# Altium project PCB_Project_MAGNIS-v1-GroundStation.PrjPcb
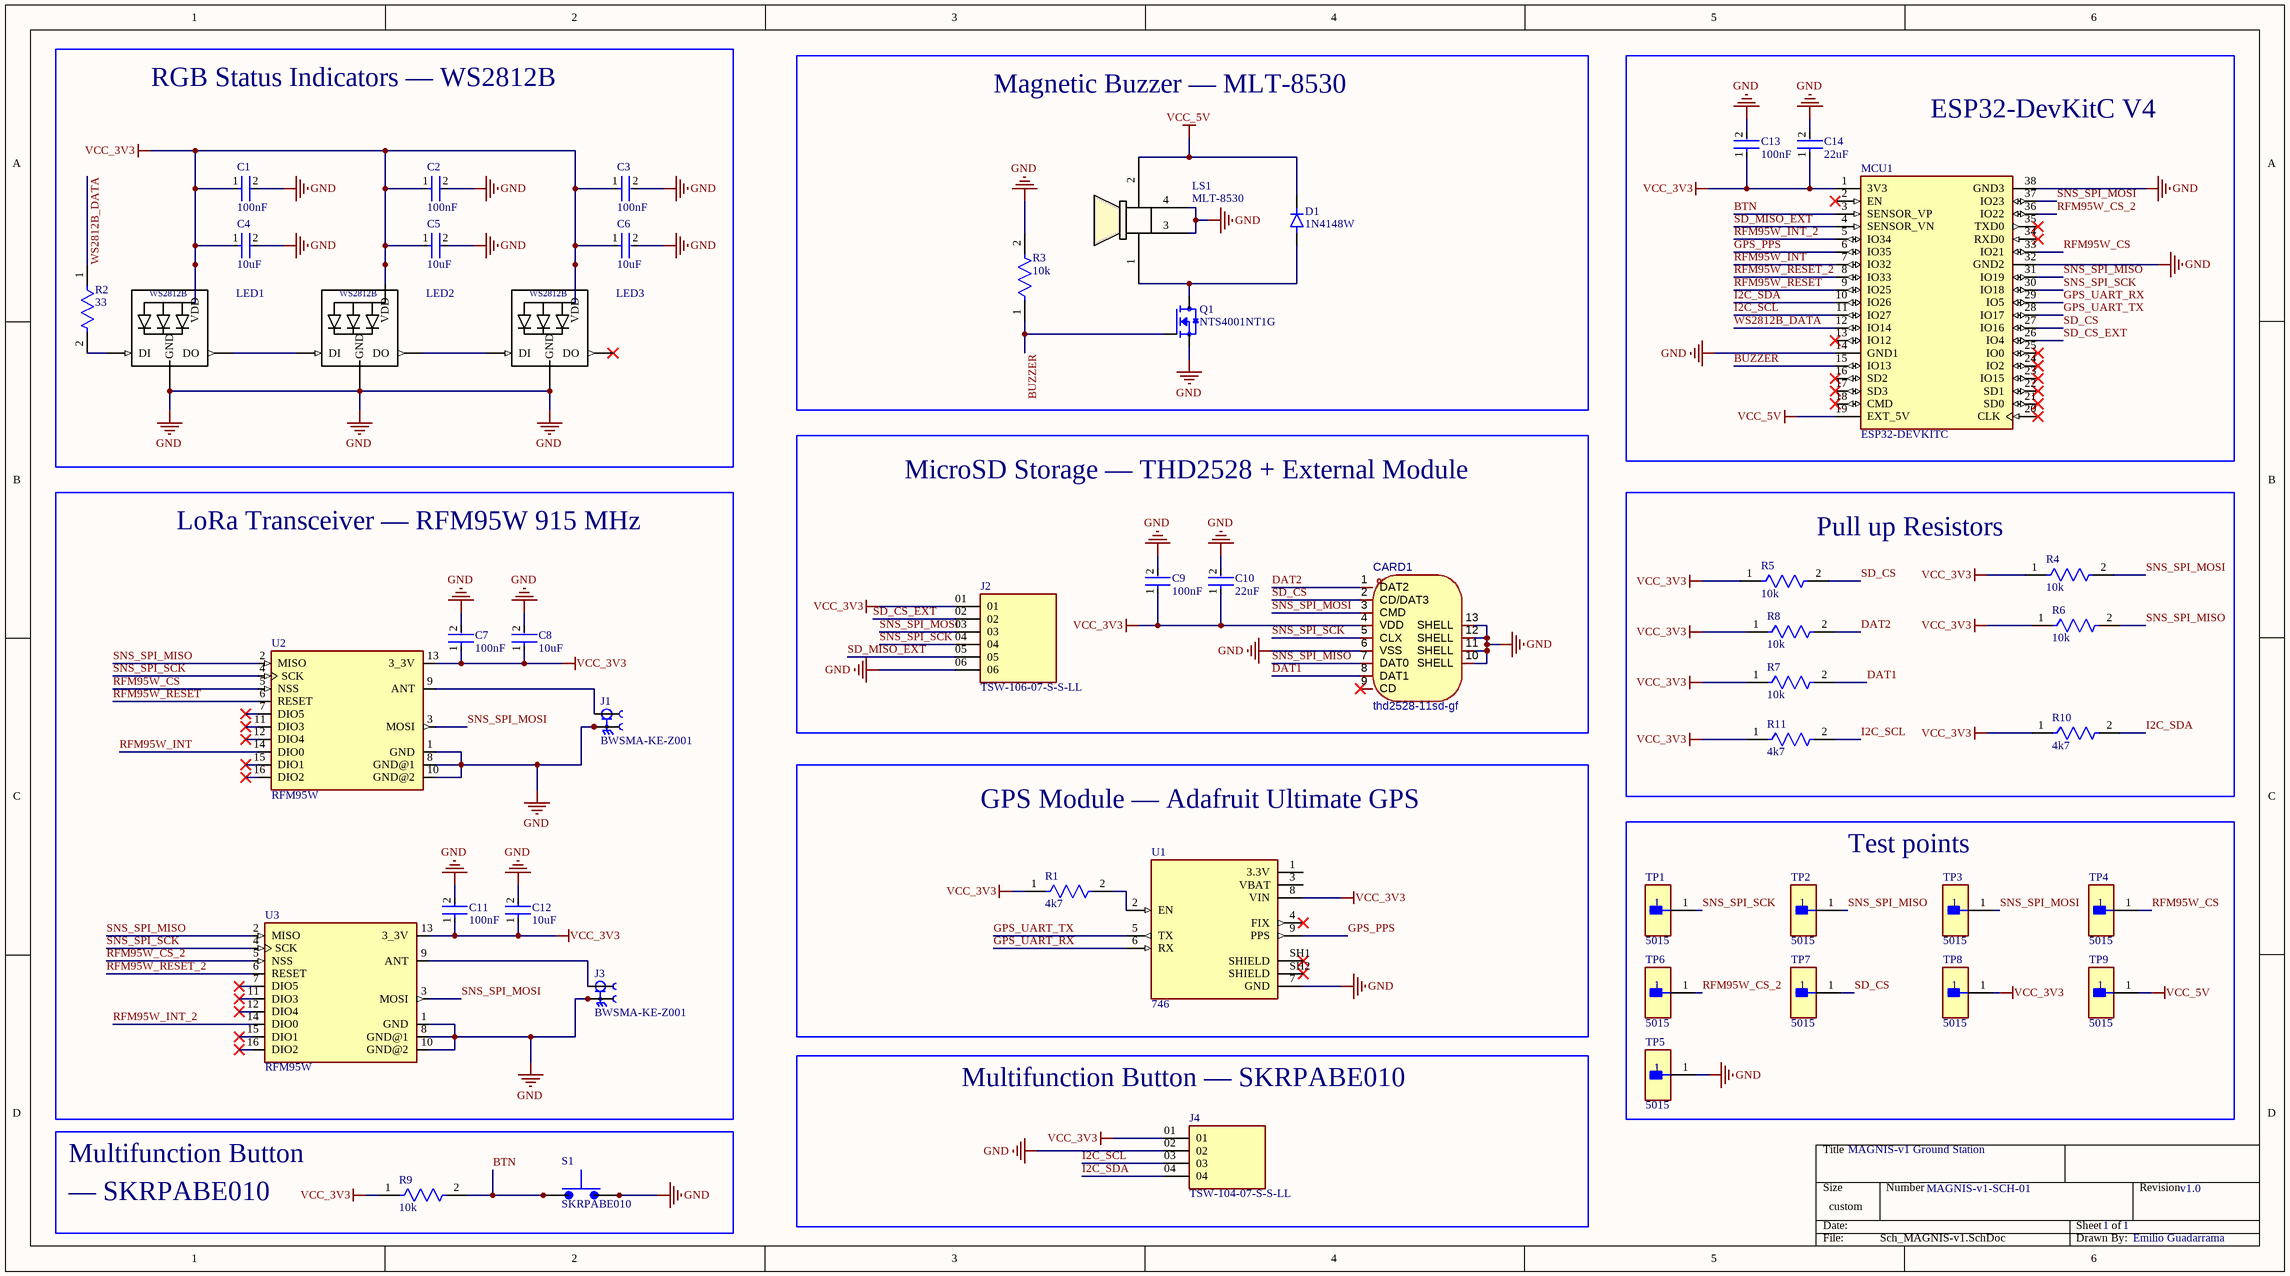
[diagram p0: Sch_MAGNIS-v1.SchDoc]
1 sheet, 50 parts. Net scope: global (net labels, ports and power ports of the same name join across sheets).
Board file: PCB_MAGNIS-v1.PcbDoc

## Sheet Sch_MAGNIS-v1.SchDoc
size 457 x 254 mm; SheetNumber: 1; SheetTotal: 1

### Parts
C1  100nF  [FP-C0805C-DN-MFG]
C2  100nF  [FP-C0805C-DN-MFG]
C3  100nF  [FP-C0805C-DN-MFG]
C4  10uF  [FP-C0805C-DN-MFG]
C5  10uF  [FP-C0805C-DN-MFG]
C6  10uF  [FP-C0805C-DN-MFG]
C7  100nF  [FP-C0805C-DN-MFG]
C8  10uF  [FP-C0805C-DN-MFG]
C9  100nF  [FP-C0805C-DN-MFG]
C10  22uF  [FP-C0805C-DN-MFG]
C11  100nF  [FP-C0805C-DN-MFG]
C12  10uF  [FP-C0805C-DN-MFG]
C13  100nF  [FP-C0805C-DN-MFG]
C14  22uF  [FP-C0805C-DN-MFG]
CARD1  thd2528-11sd-gf  [PCBComponent_1]
D1  1N4148W  [SODFL3816X120N]
J1  BWSMA-KE-Z001  [BAT_WIRELESS_BWSMA-KE-Z001]
J2  TSW-106-07-S-S-LL  [SAMTEC_TSW-106-07-S-S-LL]
J3  BWSMA-KE-Z001  [BAT_WIRELESS_BWSMA-KE-Z001]
J4  TSW-104-07-S-S-LL  [SAMTEC_TSW-104-07-S-S-LL]
LED1  WS2812B  [*LED3535]  (value not drawn)
LED2  WS2812B  [*LED3535]  (value not drawn)
LED3  WS2812B  [*LED3535]  (value not drawn)
LS1  MLT-8530  [MLT-8530_JHE]
MCU1  ESP32-DEVKITC  [MODULE_ESP32-DEVKITC]
Q1  NTS4001NT1G  [SOT65P220X100-3N]
R1  4k7  [FP-MCT0603-IPC_A]
R2  33  [FP-MCT0603-IPC_A]
R3  10k  [FP-MCT0603-IPC_A]
R4  10k  [FP-MCT0603-IPC_A]
R5  10k  [FP-MCT0603-IPC_A]
R6  10k  [FP-MCT0603-IPC_A]
R7  10k  [FP-MCT0603-IPC_A]
R8  10k  [FP-MCT0603-IPC_A]
R9  10k  [FP-MCT0603-IPC_A]
R10  4k7  [FP-MCT0603-IPC_A]
R11  4k7  [FP-MCT0603-IPC_A]
S1  SKRPABE010  [SW_SKRPABE010]
TP1  5015  [FP-5015-MFG]
TP2  5015  [FP-5015-MFG]
TP3  5015  [FP-5015-MFG]
TP4  5015  [FP-5015-MFG]
TP5  5015  [FP-5015-MFG]
TP6  5015  [FP-5015-MFG]
TP7  5015  [FP-5015-MFG]
TP8  5015  [FP-5015-MFG]
TP9  5015  [FP-5015-MFG]
U1  746  [XCVR_746]
U2  RFM95W  [XCVR_RFM95W-868S2]
U3  RFM95W  [XCVR_RFM95W-868S2]

### Blocks framed on the sheet
RGB Status Indicators — WS2812B: C1-C6 LED1-LED3 R2
Magnetic Buzzer — MLT-8530: D1 LS1 Q1 R3
ESP32-DevKitC V4: C13 C14 MCU1
MicroSD Storage — THD2528 + External Module: C9 C10 CARD1 J2
LoRa Transceiver — RFM95W 915 MHz: C7 C8 C11 C12 J1 J3 U2 U3
Pull up Resistors: R4-R8 R10 R11
GPS Module — Adafruit Ultimate GPS: R1 U1
Test points: TP1-TP9
Multifunction Button — SKRPABE010: J4

### Nets
GND: C1.2 C2.2 C3.2 C4.2 C5.2 C6.2 C7.2 C8.2 C9.2 C10.2 C11.2 C12.2 C13.2 C14.2 CARD1.6(VSS) CARD1.10(SHELL) CARD1.11(SHELL) CARD1.12(SHELL) CARD1.13(SHELL) J1.2_1 J1.2_2 J1.2_3 J1.2_4 J2.06 J3.2_1 J3.2_2 J3.2_3 J3.2_4 J4.02 LED1.3(GND) LED2.3(GND) LED3.3(GND) LS1.3 LS1.4 MCU1.14(GND1) MCU1.32(GND2) MCU1.38(GND3) Q1.2(S) R3.2 S1.3 S1.4 TP5.1 U1.7(GND) U2.1(GND) U2.8(GND@1) U2.10(GND@2) U3.1(GND) U3.8(GND@1) U3.10(GND@2)
VCC_3V3: C1.1 C2.1 C3.1 C4.1 C5.1 C6.1 C7.1 C8.1 C9.1 C10.1 C11.1 C12.1 C13.1 C14.1 CARD1.4(VDD) J2.01 J4.01 LED1.1(VDD) LED2.1(VDD) LED3.1(VDD) MCU1.1(3V3) R1.1 R4.1 R5.1 R6.1 R7.1 R8.1 R9.1 R10.1 R11.1 TP8.1 U1.8(VIN) U2.13(3_3V) U3.13(3_3V)
VCC_5V: D1.C(K) LS1.2 MCU1.19(EXT_5V) TP9.1
BTN: MCU1.3(SENSOR_VP) R9.2 S1.1 S1.2
BUZZER: MCU1.15(IO13) Q1.1(G) R3.1
DAT1: CARD1.8(DAT1) R7.2
DAT2: CARD1.1(DAT2) R8.2
GPS_PPS: MCU1.6(IO35) U1.9(PPS)
GPS_UART_RX: MCU1.29(IO5) U1.6(RX)
GPS_UART_TX: MCU1.28(IO17) U1.5(TX)
I2C_SCL: J4.03 MCU1.11(IO27) R11.2
I2C_SDA: J4.04 MCU1.10(IO26) R10.2
RFM95W_CS: MCU1.33(IO21) TP4.1 U2.5(NSS)
RFM95W_CS_2: MCU1.36(IO22) TP6.1 U3.5(NSS)
RFM95W_INT: MCU1.7(IO32) U2.14(DIO0)
RFM95W_INT_2: MCU1.5(IO34) U3.14(DIO0)
RFM95W_RESET: MCU1.9(IO25) U2.6(RESET)
RFM95W_RESET_2: MCU1.8(IO33) U3.6(RESET)
SD_CS: CARD1.2(CD/DAT3) MCU1.27(IO16) R5.2 TP7.1
SD_CS_EXT: J2.02 MCU1.26(IO4)
SD_MISO_EXT: J2.05 MCU1.4(SENSOR_VN)
SNS_SPI_MISO: CARD1.7(DAT0) MCU1.31(IO19) R6.2 TP2.1 U2.2(MISO) U3.2(MISO)
SNS_SPI_MOSI: CARD1.3(CMD) J2.03 MCU1.37(IO23) R4.2 TP3.1 U2.3(MOSI) U3.3(MOSI)
SNS_SPI_SCK: CARD1.5(CLX) J2.04 MCU1.30(IO18) TP1.1 U2.4(SCK) U3.4(SCK)
WS2812B_DATA: MCU1.12(IO14) R2.1
NetD1_A: D1.A LS1.1 Q1.3(D)
NetJ1_1: J1.1 U2.9(ANT)
NetJ3_1: J3.1 U3.9(ANT)
NetLED1_2: LED1.2(DO) LED2.4(DI)
NetLED1_4: LED1.4(DI) R2.2
NetLED2_2: LED2.2(DO) LED3.4(DI)
NetR1_2: R1.2 U1.2(EN)

Not connected (* = marked no-connect by the designer): CARD1 9(CD)*; LED3 2(DO)*; MCU1 2(EN)* 13(IO12)* 16(SD2)* 17(SD3)* 18(CMD)* 20(CLK)* 21(SD0)* 22(SD1)* 23(IO15)* 24(IO2)* 25(IO0)* 34(RXD0)* 35(TXD0)*; U1 1(3.3V) 3(VBAT) 4(FIX)* SH1(SHIELD)* SH2(SHIELD)*; U2 7(DIO5)* 11(DIO3)* 12(DIO4)* 15(DIO1)* 16(DIO2)*; U3 7(DIO5)* 11(DIO3)* 12(DIO4)* 15(DIO1)* 16(DIO2)*

### Notes on the sheet
- Multifunction Button
- MAGNIS-v1 Ground Station
- — SKRPABE010
- MAGNIS-v1-SCH-01
- 1
- v1.0
- Emilio Guadarrama

### Library data of the parts
C1-C14 = CMP-2007-00279-2: CAP CER 0.1UF 50V X7R 0805; Manufacturer Part Number: C0805C104K5RACTU; Manufacturer: KEMET; Value: 0.10 μF; Tolerance: 0.1; Temperature Coefficient: 30ppm/°C; Material: Ceramic; Device Class L2: Capacitors; Temperature Range Low: -55°C; Voltage Rating: 50 V; Digikey Description: CAP CER 0.1UF 50V X7R 0805; Category: Cap; ComponentLink2Description: Datasheet; Octopart: https://octopart.com/c0805c104k5ractu-kemet-143926; RoHS: TRUE; ComponentLink2URL: https://content.kemet.com/datasheets/KEM_C1003_C0G_SMD.pdf; Temperature Characteristic: X7R; Temperature: -55°C to +125°C; Height: 0.88mm; Temperature Range High: +125°C; Device Class L1: Passive Components; Automotive: No; Lead Free: Yes; Ipc Land Pattern Name: CAPC200125X78; Device Class L3: Ceramic Capacitors; Mouser Description: Cap Ceramic 0.1uF 50V X7R 10% SMD 2.0 x 1.2 mm 125 C Paper T/R; Capacitance: 0.10 μF; Package: C0805C-DN
CARD1 = thd2528-11sd-gf: Card Connection Mode:Push-Push Card Type:MicroSD Card (TF Card) Connector Type:Connector and Ejector Additional Card Detection Pins:No Height Above Board:2mm Operating Temperature:- Operating Temperature:-; Manufacturer: THD(台华达); AddInBom: yes; ModelId: 1386afa97a0040b3a0d9dc55a27a422f; ModelName: TF-SMD_THD2528-11SD-GF; ModelTransform: 635.826,598.424,0,0,0,0,0,-82.677,-23.622; Additional Card Detection Pins: No; Symbol: THD2528-11SD-GF; Supplier: LCSC; Supplier Part: C283232; Manufacturer Part: THD2528-11SD-GF; JLCPCB Part Class: Extended Part; LCSC Part Name: 自弹式 MicroSD卡(TF卡) 卡座; Supplier Footprint: SMD; Datasheet: https://item.szlcsc.com/datasheet/THD2528-11SD-GF/268992.html; ConvertToPcb: yes; FootprintName: TF-SMD_THD2528-11SD-GF; Card Connection Mode: Push-Push; Card Type: MicroSD Card (TF Card); Connector Type: Connector and Ejector; Height Above Board: 2mm; Operating Temperature: -
D1 = 1N4148W: Small Signal Diode, SOD-123F, 100V, 0.15A, 150Â°C; MF: Diotec Semiconductor; SnapEDA_Link: https://www.snapeda.com/parts/1N4148W/Diotec/view-part/?ref=snap; Package: SOD-123F Diotec; Value: *; MP: 1N4148W; Check_prices: https://www.snapeda.com/parts/1N4148W/Diotec/view-part/?ref=eda
J1 J3 = BWSMA-KE-Z001: 1 Inner bore SMA Board Edge Positive foot -65â„ƒ~+165â„ƒ 50Î© Plugin RF Connectors / Coaxial Connectors ROHS; MF: Bat Wireless; SnapEDA_Link: https://www.snapeda.com/parts/BWSMA-KE-Z001/Bat+Wireless/view-part/?ref=snap; Package: None; Value: *; MP: BWSMA-KE-Z001; Check_prices: https://www.snapeda.com/parts/BWSMA-KE-Z001/Bat+Wireless/view-part/?ref=eda
LED1-LED3 = WS2812B: Intelligent control LED integrated light source; MF: Worldsemi; SnapEDA_Link: https://www.snapeda.com/parts/WS2812B/Worldsemi/view-part/?ref=snap; Package: None; MP: WS2812B; Check_prices: https://www.snapeda.com/parts/WS2812B/Worldsemi/view-part/?ref=eda; Value: *
LS1 = MLT-8530: Description; Manufacturer_Name: Jiangsu Huaneng Elec; Copyright: Copyright (C) 2025 Ultra Librarian. All rights reserved.; Manufacturer_Part_Number: MLT-8530; RefDes: RefDes; Type: Type
MCU1 = ESP32-DEVKITC: ESP32-WROOM-32UE series Transceiver; 802.11 b/g/n (Wi-Fi, WiFi, WLAN), Bluetooth Â® Smart Ready 4.x Dual Mode Evaluation Board; MF: Espressif Systems; SnapEDA_Link: https://www.snapeda.com/parts/ESP32-DEVKITC/Espressif+Systems/view-part/?ref=snap; Package: None; Value: *; MP: ESP32-DEVKITC; Check_prices: https://www.snapeda.com/parts/ESP32-DEVKITC/Espressif+Systems/view-part/?ref=eda
Q1 = NTS4001NT1G: N-Channel 30V 270mA _Ta_ 330mW _Ta_ Surface Mount SC-70-3 _SOT323_; MF: ON Semiconductor; Package: SC-70 ON Semiconductor; MP: NTS4001NT1G; SnapEDA_Link: https://www.snapeda.com/parts/NTS4001NT1G/ON%20Semiconductor/view-part/274588/?ref=snap; Price: None; Value: *; Availability: Unavailable
R1-R11 = CMP-02407-011165-1: RES SMD 100 OHM 1% 1/8W 0603; Temperature Coefficient: 25ppm/°C; Resistance: 20kR; Power Rating: 125mW; Tolerance: 0.1%; Voltage Rating: 75V; Length: 1.55mm; Case Code (Imperial): 0603; Case/Package: 0603; Construction: Rectangular; Package Quantity: 1000; Number of Terminations: 2; Termination: SMD/SMT; Resistor Type: Thin Film; Features: Automotive AEC-Q200; Series: MCT 0603 - Precision; Max Operating Temperature: 155°C; Depth: 0.85mm; Max Power Dissipation: 125mW; Min Operating Temperature: -55°C; Width: 0.033inch; Case Code (Metric): 1608; Packaging: Tape and Reel; Weight: 6.7E-05oz; Military Standard: Not; Height: 0.022inch
S1 = SKRPABE010: Switch Tactile N.O. SPST Button J-Bend 0.05A 16VDC 1.57N SMD Automotive T/R; MF: ALPS; SnapEDA_Link: https://www.snapeda.com/parts/SKRPABE010/ALPS/view-part/?ref=snap; Package: None; Value: *; MP: SKRPABE010; Check_prices: https://www.snapeda.com/parts/SKRPABE010/ALPS/view-part/?ref=eda
TP1-TP9 = CMP-2000-05183-2: PC TEST POINT MINIATURE; Manufacturer: keystone; Number Of Contacts: 1; Conn Orientation: Straight; Category: Conn; Manufacturer Part Number: 5015; Digikey Description: PC TEST POINT MINIATURE; Automotive: No; Lead Free: Yes; Octopart: https://octopart.com/5015-keystone-3822; ComponentLink2URL: http://www.keyelco.com/product-pdf.cfm?p=1353; Package: 5015; RoHS: TRUE; Device Class L3: unset; Device Class L2: unset; Contact Material: Silver; Device Class L1: Connectors; Height: 1.65mm; ComponentLink2Description: Datasheet
U1 = 746: Ultimate GPS Breakout, 66 channel, 10 Hz updates, 5 V, -165 dBm, MTK3339 Chipset | Adafruit Industries 746; SnapEDA_Link: https://www.snapeda.com/parts/746/Adafruit+Industries/view-part/?ref=snap; Package: NON STANDARD-11 Adafruit; Value: *; MF: Adafruit Industries; MP: 746; Check_prices: https://www.snapeda.com/parts/746/Adafruit+Industries/view-part/?ref=eda
U2 U3 = RFM95W-868S2: General ISM < 1GHz LoRaâ„¢ Transceiver Module 868MHz Antenna Not Included Surface Mount; MF: RF; Package: Non Standard RF Solutions; Price: None; Check_prices: https://www.snapeda.com/parts/RFM95W-868S2/RF+Solutions/view-part/?ref=eda; Value: *; SnapEDA_Link: https://www.snapeda.com/parts/RFM95W-868S2/RF+Solutions/view-part/?ref=snap; MP: RFM95W-868S2; Availability: In Stock; Purchase-URL: https://pricing.snapeda.com/search?q=RFM95W-868S2&ref=eda
J2 = TSW-106-07-S-S-LL: Package: None; Price: None; Value: *; MP: TSW-106-07-S-S-LL; Availability: Unavailable
J4 = TSW-104-07-S-S-LL: Package: None; Price: None; Value: *; MP: TSW-104-07-S-S-LL; Availability: Unavailable